# Altium schematic sheet RK3568-Power-Sheet.SchDoc
size 420 x 297 mm; SheetNumber: 4; SheetTotal: 25
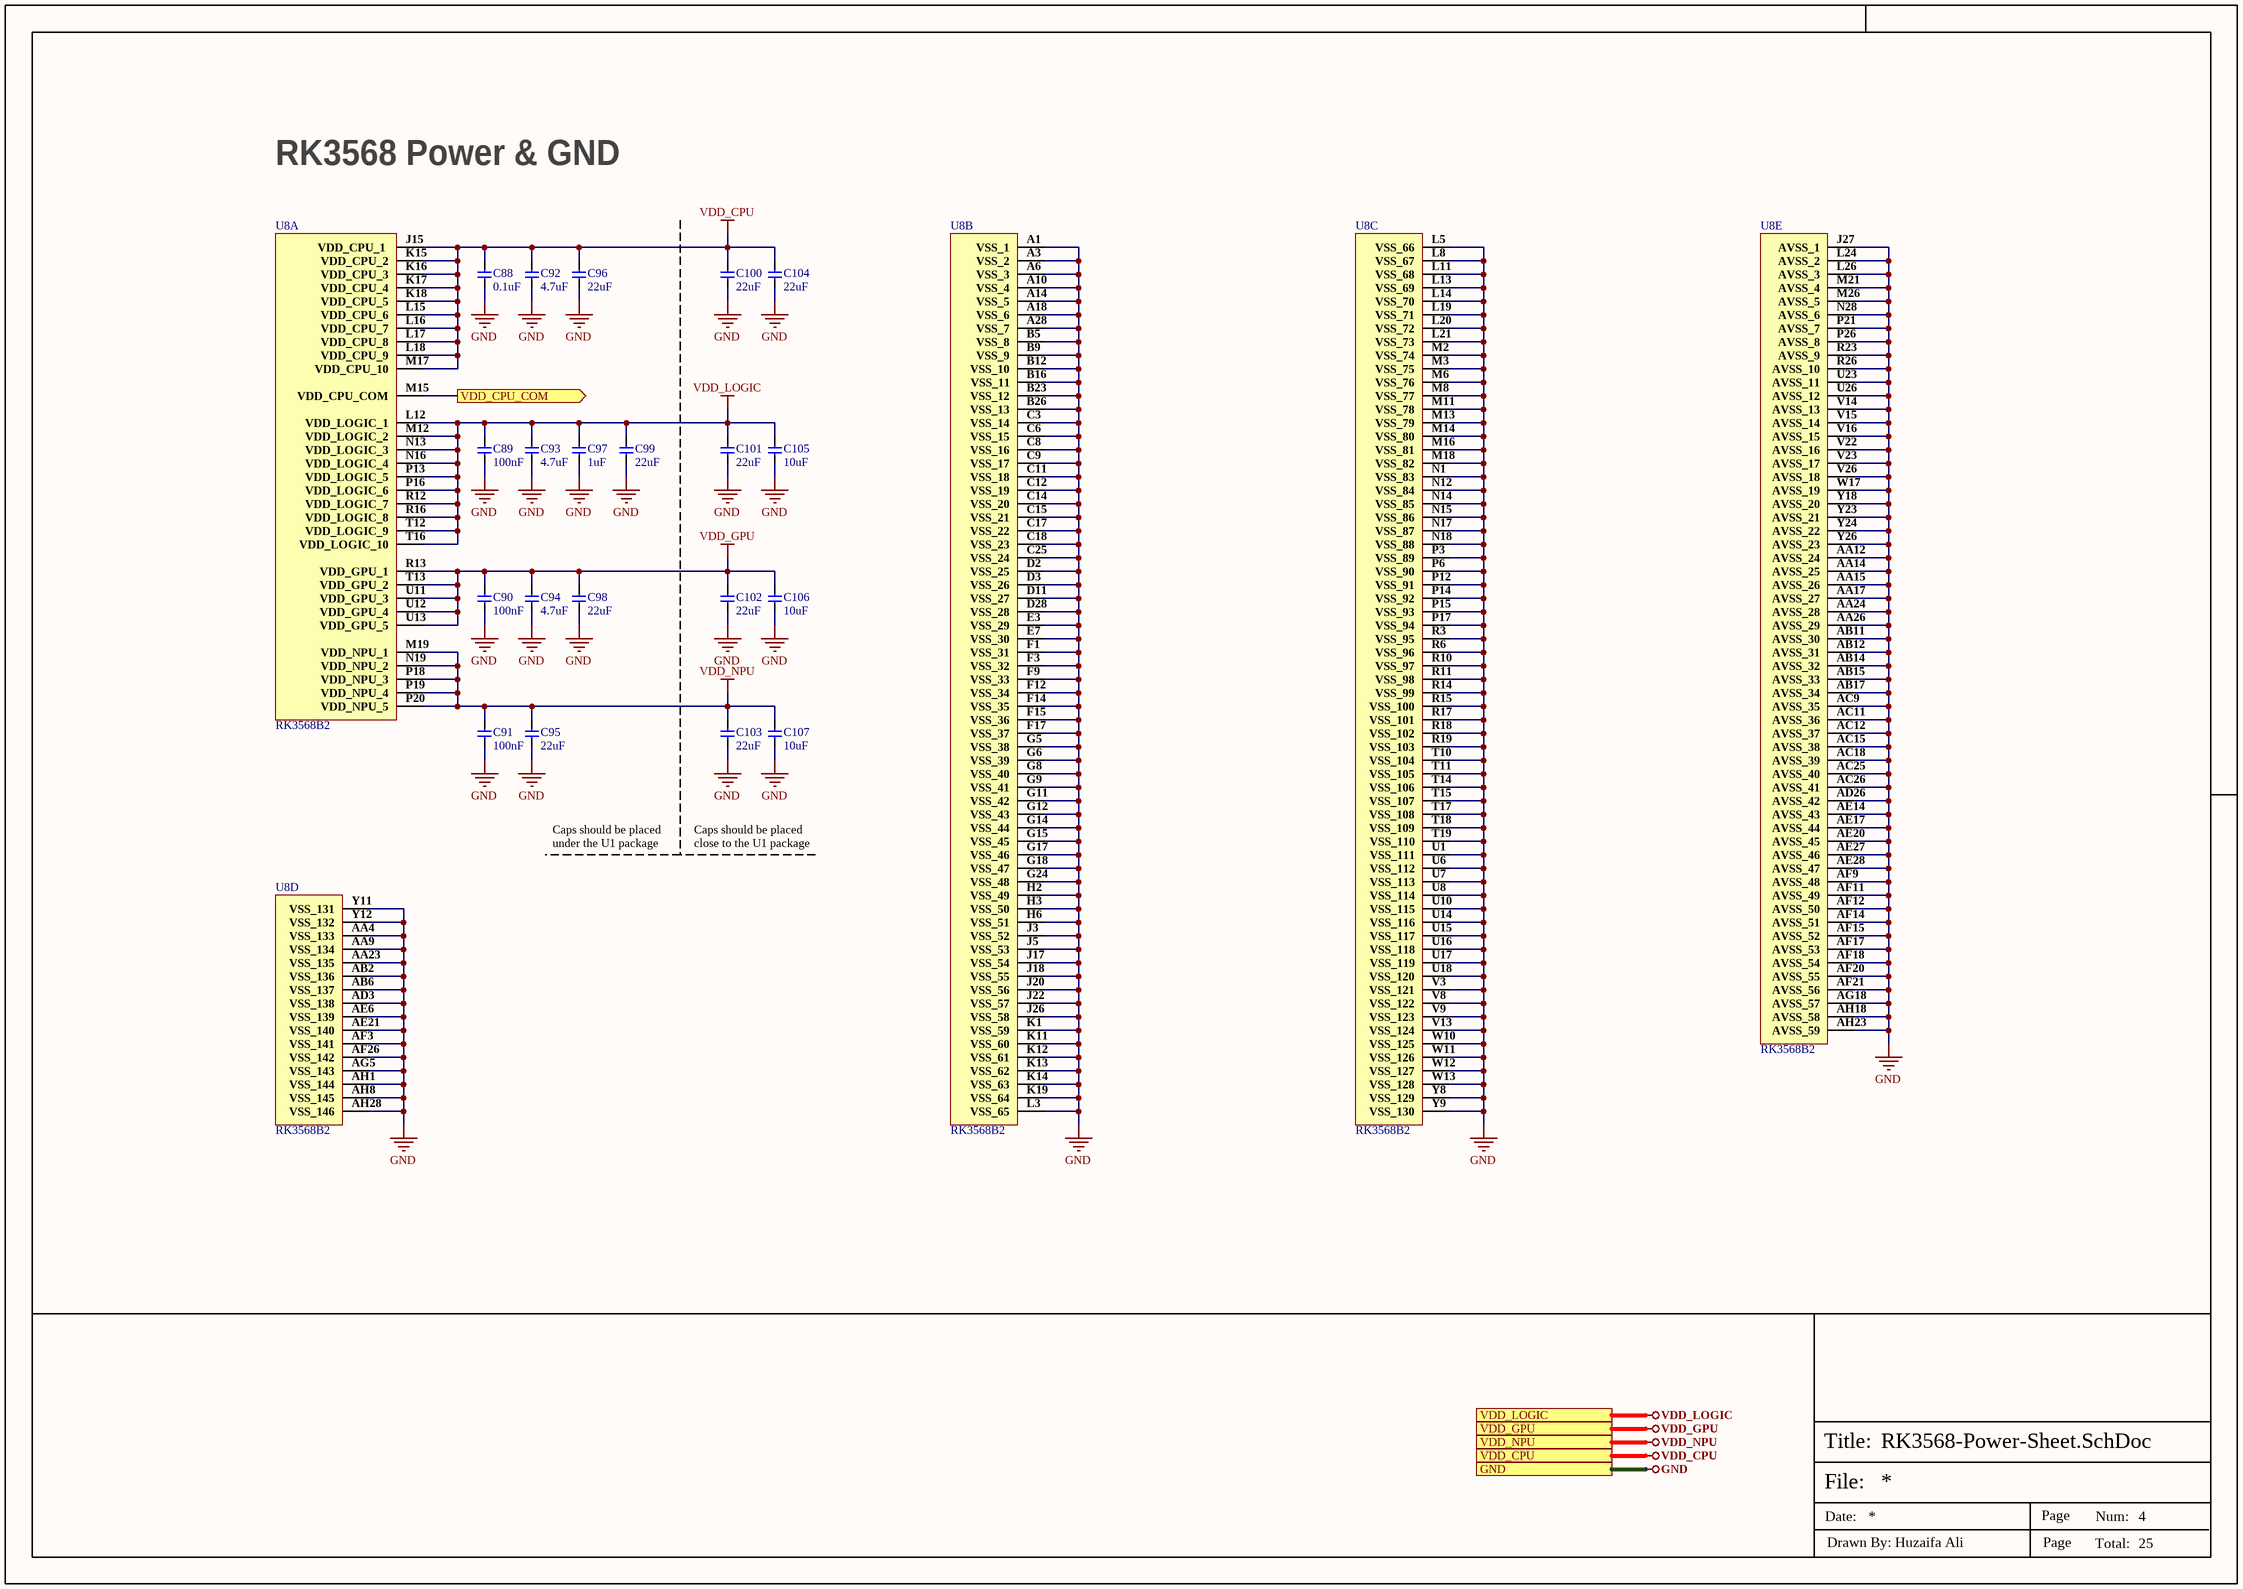
[diagram p0: RK3568-Power-Sheet.SchDoc]

## Parts
C88  0.1uF  [Cap-0402]
C89  100nF  [CAP-0201]
C90  100nF  [CAP-0201]
C91  100nF  [CAP-0201]
C92  4.7uF  [Cap-0402]
C93  4.7uF  [Cap-0402]
C94  4.7uF  [Cap-0402]
C95  22uF  [Cap-0603]
C96  22uF  [Cap-0603]
C97  1uF  [Cap-0201]
C98  22uF  [Cap-0603]
C99  22uF  [Cap-0603]
C100  22uF  [Cap-0603]
C101  22uF  [Cap-0603]
C102  22uF  [Cap-0603]
C103  22uF  [Cap-0603]
C104  22uF  [Cap-0603]
C105  10uF  [Cap-0603]
C106  10uF  [Cap-0603]
C107  10uF  [Cap-0603]
U8  RK3568B2  [FCCSP-636L]  (parts A,B,C,D,E of 23)

## Ports
GND (see Connector-Sheet[5D], DRAM-LPDDR4x-Sheet[4D], eMMC-Sheet[4D], LED-Debug-Sheet[4D], MicroSD-SPI-Flash-Sheet[4D], Power-DC-IN-Sheet[4D], Power-Others-Sheet[4D], Power-PMIC-Sheet[4D], RK3568-Audio-Interface[4D], RK3568-Flash-SD-Controller[4D], RK3568-OSC-PMUIO-Sheet[5D], RK3568-SARADC-GPIO[4D], RK3568-USB-PCIe-Sheet[5D], RK3568-VI-Interface-Sheet[4D], RK3568-VO-Interface-1[4D], RK3568-VO-Interface-2[4D], Sensors-Sheet-1[4D], Sensors-Sheet-2[5D], Type-C-Sheet[4D], USB-Ports[4D], VO-HDMI2.0-TX-Sheet[4D], VO-LCM-MIPI-DSI-TX0[4D], WIFI-BT-SDIO-Sheet[4D]), VDD_CPU (see Power-Others-Sheet[4D]), VDD_CPU_COM (out, see Power-Others-Sheet[3B]), VDD_GPU (see Power-PMIC-Sheet[3D]), VDD_LOGIC (see Power-PMIC-Sheet[3D]), VDD_NPU (see Power-PMIC-Sheet[3D])

## Nets
GND: C88.1 C89.1 C90.1 C91.1 C92.1 C93.1 C94.1 C95.1 C96.1 C97.1 C98.1 C99.1 C100.1 C101.1 C102.1 C103.1 C104.1 C105.1 C106.1 C107.1 U8.A1(VSS_1) U8.A3(VSS_2) U8.A6(VSS_3) U8.A10(VSS_4) U8.A14(VSS_5) U8.A18(VSS_6) U8.A28(VSS_7) U8.AA4(VSS_133) U8.AA9(VSS_134) U8.AA12(AVSS_24) U8.AA14(AVSS_25) U8.AA15(AVSS_26) U8.AA17(AVSS_27) U8.AA23(VSS_135) U8.AA24(AVSS_28) U8.AA26(AVSS_29) U8.AB2(VSS_136) U8.AB6(VSS_137) U8.AB11(AVSS_30) U8.AB12(AVSS_31) U8.AB14(AVSS_32) U8.AB15(AVSS_33) U8.AB17(AVSS_34) U8.AC9(AVSS_35) U8.AC11(AVSS_36) U8.AC12(AVSS_37) U8.AC15(AVSS_38) U8.AC18(AVSS_39) U8.AC25(AVSS_40) U8.AC26(AVSS_41) U8.AD3(VSS_138) U8.AD26(AVSS_42) U8.AE6(VSS_139) U8.AE14(AVSS_43) U8.AE17(AVSS_44) U8.AE20(AVSS_45) U8.AE21(VSS_140) U8.AE27(AVSS_46) U8.AE28(AVSS_47) U8.AF3(VSS_141) U8.AF9(AVSS_48) U8.AF11(AVSS_49) U8.AF12(AVSS_50) U8.AF14(AVSS_51) U8.AF15(AVSS_52) U8.AF17(AVSS_53) U8.AF18(AVSS_54) U8.AF20(AVSS_55) U8.AF21(AVSS_56) U8.AF26(VSS_142) U8.AG5(VSS_143) U8.AG18(AVSS_57) U8.AH1(VSS_144) U8.AH8(VSS_145) U8.AH18(AVSS_58) U8.AH23(AVSS_59) U8.AH28(VSS_146) U8.B5(VSS_8) U8.B9(VSS_9) U8.B12(VSS_10) U8.B16(VSS_11) U8.B23(VSS_12) U8.B26(VSS_13) U8.C3(VSS_14) U8.C6(VSS_15) U8.C8(VSS_16) U8.C9(VSS_17) U8.C11(VSS_18) U8.C12(VSS_19) U8.C14(VSS_20) U8.C15(VSS_21) U8.C17(VSS_22) U8.C18(VSS_23) U8.C25(VSS_24) U8.D2(VSS_25) U8.D3(VSS_26) U8.D11(VSS_27) U8.D28(VSS_28) U8.E3(VSS_29) U8.E7(VSS_30) U8.F1(VSS_31) U8.F3(VSS_32) U8.F9(VSS_33) U8.F12(VSS_34) U8.F14(VSS_35) U8.F15(VSS_36) U8.F17(VSS_37) U8.G5(VSS_38) U8.G6(VSS_39) U8.G8(VSS_40) U8.G9(VSS_41) U8.G11(VSS_42) U8.G12(VSS_43) U8.G14(VSS_44) U8.G15(VSS_45) U8.G17(VSS_46) U8.G18(VSS_47) U8.G24(VSS_48) U8.H2(VSS_49) U8.H3(VSS_50) U8.H6(VSS_51) U8.J3(VSS_52) U8.J5(VSS_53) U8.J17(VSS_54) U8.J18(VSS_55) U8.J20(VSS_56) U8.J22(VSS_57) U8.J26(VSS_58) U8.J27(AVSS_1) U8.K1(VSS_59) U8.K11(VSS_60) U8.K12(VSS_61) U8.K13(VSS_62) U8.K14(VSS_63) U8.K19(VSS_64) U8.L3(VSS_65) U8.L5(VSS_66) U8.L8(VSS_67) U8.L11(VSS_68) U8.L13(VSS_69) U8.L14(VSS_70) U8.L19(VSS_71) U8.L20(VSS_72) U8.L21(VSS_73) U8.L24(AVSS_2) U8.L26(AVSS_3) U8.M2(VSS_74) U8.M3(VSS_75) U8.M6(VSS_76) U8.M8(VSS_77) U8.M11(VSS_78) U8.M13(VSS_79) U8.M14(VSS_80) U8.M16(VSS_81) U8.M18(VSS_82) U8.M21(AVSS_4) U8.M26(AVSS_5) U8.N1(VSS_83) U8.N12(VSS_84) U8.N14(VSS_85) U8.N15(VSS_86) U8.N17(VSS_87) U8.N18(VSS_88) U8.N28(AVSS_6) U8.P3(VSS_89) U8.P6(VSS_90) U8.P12(VSS_91) U8.P14(VSS_92) U8.P15(VSS_93) U8.P17(VSS_94) U8.P21(AVSS_7) U8.P26(AVSS_8) U8.R3(VSS_95) U8.R6(VSS_96) U8.R10(VSS_97) U8.R11(VSS_98) U8.R14(VSS_99) U8.R15(VSS_100) U8.R17(VSS_101) U8.R18(VSS_102) U8.R19(VSS_103) U8.R23(AVSS_9) U8.R26(AVSS_10) U8.T10(VSS_104) U8.T11(VSS_105) U8.T14(VSS_106) U8.T15(VSS_107) U8.T17(VSS_108) U8.T18(VSS_109) U8.T19(VSS_110) U8.U1(VSS_111) U8.U6(VSS_112) U8.U7(VSS_113) U8.U8(VSS_114) U8.U10(VSS_115) U8.U14(VSS_116) U8.U15(VSS_117) U8.U16(VSS_118) U8.U17(VSS_119) U8.U18(VSS_120) U8.U23(AVSS_11) U8.U26(AVSS_12) U8.V3(VSS_121) U8.V8(VSS_122) U8.V9(VSS_123) U8.V13(VSS_124) U8.V14(AVSS_13) U8.V15(AVSS_14) U8.V16(AVSS_15) U8.V22(AVSS_16) U8.V23(AVSS_17) U8.V26(AVSS_18) U8.W10(VSS_125) U8.W11(VSS_126) U8.W12(VSS_127) U8.W13(VSS_128) U8.W17(AVSS_19) U8.Y8(VSS_129) U8.Y9(VSS_130) U8.Y11(VSS_131) U8.Y12(VSS_132) U8.Y18(AVSS_20) U8.Y23(AVSS_21) U8.Y24(AVSS_22) U8.Y26(AVSS_23) ; port GND
VDD_CPU: C88.2 C92.2 C96.2 C100.2 C104.2 U8.J15(VDD_CPU_1) U8.K15(VDD_CPU_2) U8.K16(VDD_CPU_3) U8.K17(VDD_CPU_4) U8.K18(VDD_CPU_5) U8.L15(VDD_CPU_6) U8.L16(VDD_CPU_7) U8.L17(VDD_CPU_8) U8.L18(VDD_CPU_9) U8.M17(VDD_CPU_10) ; port VDD_CPU
VDD_GPU: C90.2 C94.2 C98.2 C102.2 C106.2 U8.R13(VDD_GPU_1) U8.T13(VDD_GPU_2) U8.U11(VDD_GPU_3) U8.U12(VDD_GPU_4) U8.U13(VDD_GPU_5) ; port VDD_GPU
VDD_LOGIC: C89.2 C93.2 C97.2 C99.2 C101.2 C105.2 U8.L12(VDD_LOGIC_1) U8.M12(VDD_LOGIC_2) U8.N13(VDD_LOGIC_3) U8.N16(VDD_LOGIC_4) U8.P13(VDD_LOGIC_5) U8.P16(VDD_LOGIC_6) U8.R12(VDD_LOGIC_7) U8.R16(VDD_LOGIC_8) U8.T12(VDD_LOGIC_9) U8.T16(VDD_LOGIC_10) ; port VDD_LOGIC
VDD_NPU: C91.2 C95.2 C103.2 C107.2 U8.M19(VDD_NPU_1) U8.N19(VDD_NPU_2) U8.P18(VDD_NPU_3) U8.P19(VDD_NPU_4) U8.P20(VDD_NPU_5) ; port VDD_NPU
VDD_CPU_COM: U8.M15(VDD_CPU_COM) ; port VDD_CPU_COM

## Notes on the sheet
- RK3568 Power & GND
- Caps should be placed under the U1 package
- Caps should be placed close to the U1 package
- File:
- Title:
- Date:
- Page
- Num:
- Total:
- Drawn By: Huzaifa Ali

## Library data of the parts
C88 = CC0402KRX5R6BB104: CAP CER 0.1UF 10V X5R 0402; Manufacturer: Yageo; Capacitance: 100nF; Tolerance: 10%; Dissipation Factor: 5%; Insulation Resistance: 10GR; Item Type: Capacitor; Supplier 1: Digi-Key; Manufacturer Part Number: CC0402KRX5R6BB104; RoHS: Yes; Category: Ceramic Capacitors; Stock 1: 6385580; Pricing 1: 1=0.10000, 10=0.02700, 50=0.01500, 100=0.01220, 500=0.00874, 1000=0.00687, 2500=0.00625, 5000=0.00575 (USD); Mount: Surface Mount; Case/Package: 0402; Number of Pins: 2; Case Code (Imperial): 0402; Case Code (Metric): 1005; Min Operating Temperature: -55°C; Max Operating Temperature: 85°C; Dielectric: X5R; Packaging: Tape and Reel; Voltage Rating: 10V; Package Quantity: 1; Termination: SMD/SMT; Voltage Rating (DC): 10V; Series: CC; Length: 1mm; Width: 0.02inch; Height: 0.5mm; Depth: 0.5mm; Thickness: 0.022inch; Radiation Hardening: No; RoHS Compliant: Yes; REACH SVHC: No SVHC; Lead Free: Lead Free; Halogen Free: Halogen Free; ComponentLink1URL: https://datasheet.ciiva.com/144/mlccorderingcode-144029.pdf?src-supplier=Digi-Key; ComponentLink1Description: https://datasheet.ciiva.com/144/mlccorderingcode-144029.pdf?src-supplier=Digi-Key; ComponentLink2URL: https://datasheet.ciiva.com/144/mlccorderingcode-144028.pdf?src-supplier=Digi-Key; ComponentLink2Description: https://datasheet.ciiva.com/144/mlccorderingcode-144028.pdf?src-supplier=Digi-Key; ComponentLink3URL: https://datasheet.ciiva.com/144/mlccorderingcode-144030.pdf?src-supplier=Digi-Key; ComponentLink3Description: https://datasheet.ciiva.com/144/mlccorderingcode-144030.pdf?src-supplier=Digi-Key; ComponentLink4URL: https://datasheet.ciiva.com/7978/1359354-7978091.pdf?src-supplier=Element14; ComponentLink4Description: https://datasheet.ciiva.com/7978/1359354-7978091.pdf?src-supplier=Element14; ComponentLink5URL: https://datasheet.ciiva.com/11587/upy-gphc-x5r-4v-to-50v-12-11587302.pdf?src-supplier=Avnet; ComponentLink5Description: https://datasheet.ciiva.com/11587/upy-gphc-x5r-4v-to-50v-12-11587302.pdf?src-supplier=Avnet; Supplier Part Number 1: 311-1336-1-ND; LCSC Part Number: C129131
C89-C91 = CC0201KRX5R6BB104: CAP CER 0.1UF 10V X5R 0201; Manufacturer: Yageo; Tolerance: 10%; Supplier 1: Mouser; Manufacturer Part Number: CC0201KRX5R6BB104; RoHS: Yes; Category: Ceramic Capacitors; Stock 1: 824403; Pricing 1: 1=0.10000, 10=0.02400, 50=0.02400, 100=0.01900, 1000=0.01100, 10000=0.00900 (USD); Mount: Surface Mount; Case/Package: 0201; Case Code (Imperial): 0201; Case Code (Metric): 0603; Weight: 6E-06oz; Min Operating Temperature: -55°C; Max Operating Temperature: 85°C; Capacitance: 100nF; Dielectric: X5R; Voltage Rating (DC): 10V; Packaging: Tape and Reel; Termination: SMD/SMT; Resistor Type: Ceramic; Voltage Rating: 10V; Series: CC; Construction: Flat; Length: 0.6mm; Width: 0.012inch; Height: 0.3mm; Thickness: 0.013inch; Depth: 0.3mm; Radiation Hardening: No; Lead Free: Lead Free; Halogen Free: Halogen Free; RoHS Compliant: Yes; ComponentLink1URL: https://datasheet.ciiva.com/11587/upy-gphc-x5r-4v-to-50v-12-11587190.pdf?src-supplier=Avnet; ComponentLink1Description: https://datasheet.ciiva.com/11587/upy-gphc-x5r-4v-to-50v-12-11587190.pdf?src-supplier=Avnet; Supplier Part Number 1: 603-CC201KRX5R6BB104; LCSC Part Number: C190183
C92-C94 = CC0402KRX5R5BB475: CAP CER 4.7UF 6.3V X5R 0402; Manufacturer: Yageo; Tolerance: 10%; Item Type: Capacitor; Supplier 1: Arrow Electronics; Manufacturer Part Number: CC0402KRX5R5BB475; RoHS: Yes; Category: Ceramic Capacitors; Stock 1: 890000; Pricing 1: 10000=0.02120, 20000=0.02030, 30000=0.02010, 50000=0.01930, 100000=0.01760, 250000=0.01630 (USD); Case/Package: 0402; Voltage Rating (DC): 6.3V; Dielectric: X5R; Capacitance: 4.7uF; Lead Free: Lead Free; Halogen Free: Halogen Free; RoHS Compliant: Yes; ComponentLink1URL: http://www.yageo.com/documents/recent/UPY-GPHC_X5R_4V-to-50V_25.pdf?src-supplier=Digi-Key; ComponentLink1Description: http://www.yageo.com/documents/recent/UPY-GPHC_X5R_4V-to-50V_25.pdf?src-supplier=Digi-Key; ComponentLink2URL: https://www.yageo.com/upload/media/product/productsearch/datasheet/mlcc/UPY-GPHC_X5R_4V-to-50V_26.pdf?src-supplier=Digi-Key; ComponentLink2Description: https://www.yageo.com/upload/media/product/productsearch/datasheet/mlcc/UPY-GPHC_X5R_4V-to-50V_26.pdf?src-supplier=Digi-Key; LCSC Part Number: C541466; Supplier Part Number 1: CC0402KRX5R5BB475
C95 C96 C98-C104 = CC0603MRX5R5BB226: CAP CER 22UF 6.3V X5R 0603; Manufacturer: Yageo; Tolerance: 20%; Supplier 1: Mouser; Manufacturer Part Number: CC0603MRX5R5BB226; RoHS: Yes; Category: Ceramic Capacitors; Stock 1: 3030; Pricing 1: 1=0.33000, 10=0.22500, 50=0.22500, 100=0.12800, 1000=0.07900, 10000=0.06500 (USD); Mount: Surface Mount; Case/Package: 0603; Case Code (Metric): 1608; Case Code (Imperial): 0603; Weight: 7.1E-05oz; Min Operating Temperature: -55°C; Max Operating Temperature: 85°C; Capacitance: 22uF; Packaging: Tape and Reel; Dielectric: X5R; Voltage Rating: 6.3V; Termination: SMD/SMT; Resistor Type: Ceramic; Voltage Rating (DC): 6.3V; Package Quantity: 4000; Length: 0.063inch; Width: 0.031inch; Thickness: 0.035inch; Depth: 0.8mm; Lead Free: Lead Free; Halogen Free: Halogen Free; RoHS Compliant: Yes; ComponentLink1URL: http://www.mouser.com/ds/2/447/Yageo_UPY-GP_NP0_16V-to-50V_9-358835.pdf?src-supplier=Mouser; ComponentLink1Description: http://www.mouser.com/ds/2/447/Yageo_UPY-GP_NP0_16V-to-50V_9-358835.pdf?src-supplier=Mouser; ComponentLink2URL: http://www.yageo.com/documents/recent/UPY-GPHC_X5R_4V-to-50V_25.pdf?src-supplier=Digi-Key; ComponentLink2Description: http://www.yageo.com/documents/recent/UPY-GPHC_X5R_4V-to-50V_25.pdf?src-supplier=Digi-Key; Supplier Part Number 1: 603-CC603MRX5R5BB226; LCSC Part Number: C109448
C97 = CC0201KRX5R5BB105: CAP CER 1UF 6.3V X5R 0201; Manufacturer: Yageo; Tolerance: 10%; Item Type: Capacitor; Supplier 1: Arrow Electronics; Manufacturer Part Number: CC0201KRX5R5BB105; RoHS: Yes; Category: Ceramic Capacitors; Stock 1: 600000; Pricing 1: 15000=0.00740 (USD); Mount: Surface Mount; Case/Package: 0201; Case Code (Imperial): 0201; Case Code (Metric): 0603; Min Operating Temperature: -55°C; Max Operating Temperature: 85°C; Packaging: Cut Tape; Capacitance: 1uF; Voltage Rating: 6.3V; RoHS Compliant: Yes; ComponentLink1URL: http://www.yageo.com/documents/recent/UPY-GPHC_X5R_4V-to-50V_25.pdf?src-supplier=Digi-Key; ComponentLink1Description: http://www.yageo.com/documents/recent/UPY-GPHC_X5R_4V-to-50V_25.pdf?src-supplier=Digi-Key; ComponentLink2URL: https://www.yageo.com/upload/media/product/productsearch/datasheet/mlcc/UPY-GPHC_X5R_4V-to-50V_26.pdf?src-supplier=Digi-Key; ComponentLink2Description: https://www.yageo.com/upload/media/product/productsearch/datasheet/mlcc/UPY-GPHC_X5R_4V-to-50V_26.pdf?src-supplier=Digi-Key; Supplier Part Number 1: CC0201KRX5R5BB105; LCSC Part Number: C541330
C105-C107 = GRM188R60J106ME47D: CAP CER 10UF 6.3V X5R 0603; Manufacturer: Murata; Material: Ceramic; Tolerance: 20%; Item Type: Capacitor; Supplier 1: Avnet; Manufacturer Part Number: GRM188R60J106ME47D; RoHS: Yes; Category: Ceramic Capacitors; Stock 1: 513625; Pricing 1: 4000=0.02461, 8000=0.02328, 16000=0.02195, 24000=0.02062, 32000=0.01929, 40000=0.01796, 400000=0.01663 (USD); Mount: Surface Mount; Case/Package: 0603; Case Code (Metric): 1608; Case Code (Imperial): 0603; Weight: 0.000222oz; Min Operating Temperature: -55°C; Max Operating Temperature: 85°C; Capacitance: 10uF; Dielectric: X5R; Packaging: Cut Tape; Package Quantity: 4000; Voltage Rating: 6.3V; Voltage Rating (DC): 6.3V; Termination: Standard; Voltage: 6.3V; Series: GRM; Length: 1.6mm; Width: 0.8mm; Height: 0.8mm; Thickness: 0.035inch; Depth: 0.8mm; Radiation Hardening: No; Reach SVHC Compliant: Yes; Lead Free: Lead Free; RoHS Compliant: Yes; ComponentLink1URL: https://datasheet.ciiva.com/22776/1747457-22776418.pdf?src-supplier=Farnell; ComponentLink1Description: https://datasheet.ciiva.com/22776/1747457-22776418.pdf?src-supplier=Farnell; ComponentLink2URL: https://datasheet.ciiva.com/28584/415295-28584232.pdf?src-supplier=Element14; ComponentLink2Description: https://datasheet.ciiva.com/28584/415295-28584232.pdf?src-supplier=Element14; ComponentLink3URL: https://datasheet.ciiva.com/3777/10175grm188r60j106me4723-3777268.pdf?src-supplier=Arrow+Electronics; ComponentLink3Description: https://datasheet.ciiva.com/3777/10175grm188r60j106me4723-3777268.pdf?src-supplier=Arrow+Electronics; ComponentLink4URL: https://datasheet.ciiva.com/29202/450781-da-01-de-vs-chip-kond-0603-10-0-uf-20pr-6-3v-x5r-29202806.pdf?src-supplier=Conrad; ComponentLink4Description: https://datasheet.ciiva.com/29202/450781-da-01-de-vs-chip-kond-0603-10-0-uf-20pr-6-3v-x5r-29202806.pdf?src-supplier=Conrad; ComponentLink5URL: https://datasheet.ciiva.com/29199/454401-da-01-en-vs-kondensator-0603-29199677.pdf?src-supplier=Conrad; ComponentLink5Description: https://datasheet.ciiva.com/29199/454401-da-01-en-vs-kondensator-0603-29199677.pdf?src-supplier=Conrad; ComponentLink6URL: https://datasheet.ciiva.com/14116/grmseries-highdielectrictype-eng-14116428.pdf?src-supplier=Distrelec; ComponentLink6Description: https://datasheet.ciiva.com/14116/grmseries-highdielectrictype-eng-14116428.pdf?src-supplier=Distrelec; ComponentLink7URL: https://datasheet.ciiva.com/138/partnumbering-e-01-138659.pdf?src-supplier=Digi-Key; ComponentLink7Description: https://datasheet.ciiva.com/138/partnumbering-e-01-138659.pdf?src-supplier=Digi-Key; ComponentLink8URL: https://datasheet.ciiva.com/138/partnumbering-e-01-138658.pdf?src-supplier=Digi-Key; ComponentLink8Description: https://datasheet.ciiva.com/138/partnumbering-e-01-138658.pdf?src-supplier=Digi-Key; ComponentLink9URL: https://datasheet.ciiva.com/138/partnumbering-e-01-138660.pdf?src-supplier=Digi-Key; ComponentLink9Description: https://datasheet.ciiva.com/138/partnumbering-e-01-138660.pdf?src-supplier=Digi-Key; ComponentLink10URL: https://datasheet.ciiva.com/16373/l0005e-16373580.pdf?src-supplier=Future+Electronics; ComponentLink10Description: https://datasheet.ciiva.com/16373/l0005e-16373580.pdf?src-supplier=Future+Electronics; Supplier Part Number 1: GRM188R60J106ME47D; LCSC Part Number: C77041
U8 = RK3568B2: FCCSP-636L Microcontroller Units (MCUs/MPUs/SOCs) ROHS; Manufacturer: Rockchip; Item Type: IC; Manufacturer Part Number: RK3568B2; Package: FCCSP-636L; LCSC Part Number: C3345225